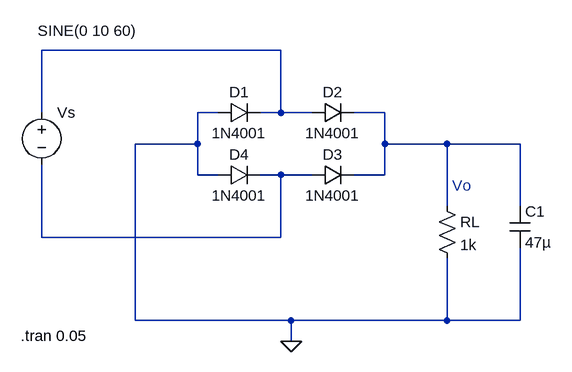
[diagram p0: schematic Draft3.asc]
Draft3.asc, the LTspice schematic file:
Version 4
SHEET 1 880 680
WIRE -64 -400 -432 -400
WIRE -432 -304 -432 -400
WIRE -160 -304 -192 -304
WIRE -64 -304 -64 -400
WIRE -64 -304 -96 -304
WIRE -16 -304 -64 -304
WIRE 96 -304 48 -304
WIRE -192 -256 -192 -304
WIRE -192 -256 -288 -256
WIRE 96 -256 96 -304
WIRE 192 -256 96 -256
WIRE 304 -256 192 -256
WIRE -192 -208 -192 -256
WIRE -160 -208 -192 -208
WIRE -64 -208 -96 -208
WIRE -16 -208 -64 -208
WIRE 96 -208 96 -256
WIRE 96 -208 48 -208
WIRE 192 -160 192 -256
WIRE 304 -160 304 -256
WIRE -432 -112 -432 -224
WIRE -64 -112 -64 -208
WIRE -64 -112 -432 -112
WIRE -288 16 -288 -256
WIRE -48 16 -288 16
WIRE 192 16 192 -80
WIRE 192 16 -48 16
WIRE 304 16 304 -96
WIRE 304 16 192 16
WIRE -48 48 -48 16
FLAG -48 48 0
SYMBOL diode -160 -288 R270
WINDOW 0 32 32 VTop 2
WINDOW 3 0 32 VBottom 2
SYMATTR InstName D1
SYMATTR Value 1N4001
SYMBOL diode -16 -288 R270
WINDOW 0 32 32 VTop 2
WINDOW 3 0 32 VBottom 2
SYMATTR InstName D2
SYMATTR Value 1N4001
SYMBOL diode -16 -192 R270
WINDOW 0 32 32 VTop 2
WINDOW 3 0 32 VBottom 2
SYMATTR InstName D3
SYMATTR Value 1N4001
SYMBOL diode -160 -192 R270
WINDOW 0 32 32 VTop 2
WINDOW 3 0 32 VBottom 2
SYMATTR InstName D4
SYMATTR Value 1N4001
SYMBOL res 176 -176 R0
SYMATTR InstName RL
SYMATTR Value 1k
SYMBOL voltage -432 -320 R0
WINDOW 123 0 0 Left 0
WINDOW 39 0 0 Left 0
WINDOW 3 -6 -110 Left 2
SYMATTR Value SINE(0 10 60)
SYMATTR InstName Vs
SYMBOL cap 288 -160 R0
SYMATTR InstName C1
SYMATTR Value 47µ
TEXT 200 -192 Left 2 ;Vo
TEXT -464 40 Left 2 !.tran 0.05

The netlist it stands for:
* Draft3.asc
D1 0 N001 1N4001
D2 N001 N002 1N4001
D3 N003 N002 1N4001
D4 0 N003 1N4001
RL N002 0 1k
Vs N001 N003 SINE(0 10 60)
C1 N002 0 47µ
.model D D
.lib standard.dio
* Vo
.tran 0.05
.backanno
.end